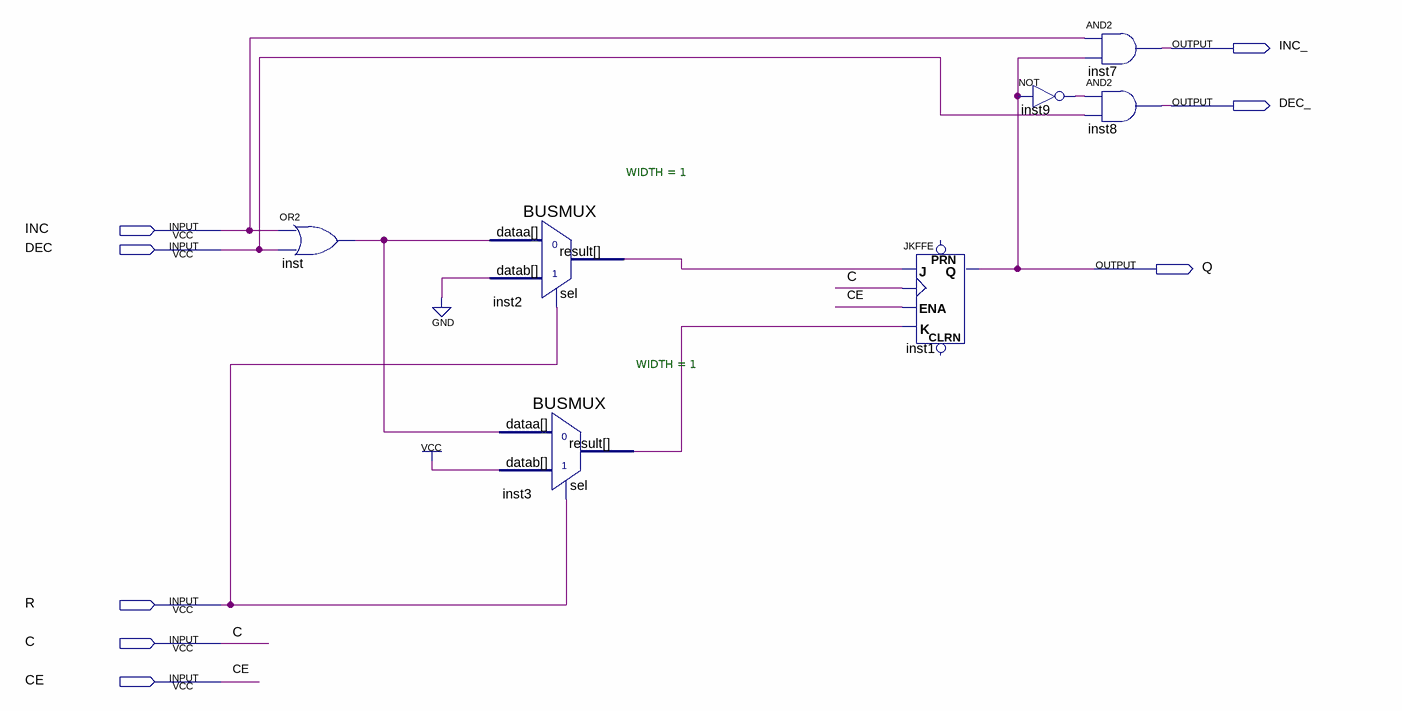
[diagram p0: schematic sheet]
// Quartus schematic TransCTEB.bdf as structural Verilog: 7 symbols, 8 pins
module TransCTEB (
  input  INC,
  input  DEC,
  input  R,
  input  C,
  input  CE,
  output INC_,
  output DEC_,
  output Q
);

  wire inst2_result, inst3_result, inst9_out, inst_out;

  or inst (inst_out, INC, DEC);
  BUSMUX #(.WIDTH(1)) inst2 (.datab(1'b0), .sel(R), .dataa(inst_out), .result(inst2_result));
  BUSMUX #(.WIDTH(1)) inst3 (.datab(1'b1), .sel(R), .dataa(inst_out), .result(inst3_result));
  JKFFE inst1 (.J(inst2_result), .CLK(C), .K(inst3_result), .ENA(CE), .Q(Q));  // open: PRN, CLRN
  not inst9 (inst9_out, Q);
  and inst7 (INC_, INC, Q);
  and inst8 (DEC_, inst9_out, DEC);
endmodule
